# Altium project 24V-70A-Power-Board-v2.0.PrjPcb (part 8 of 8)
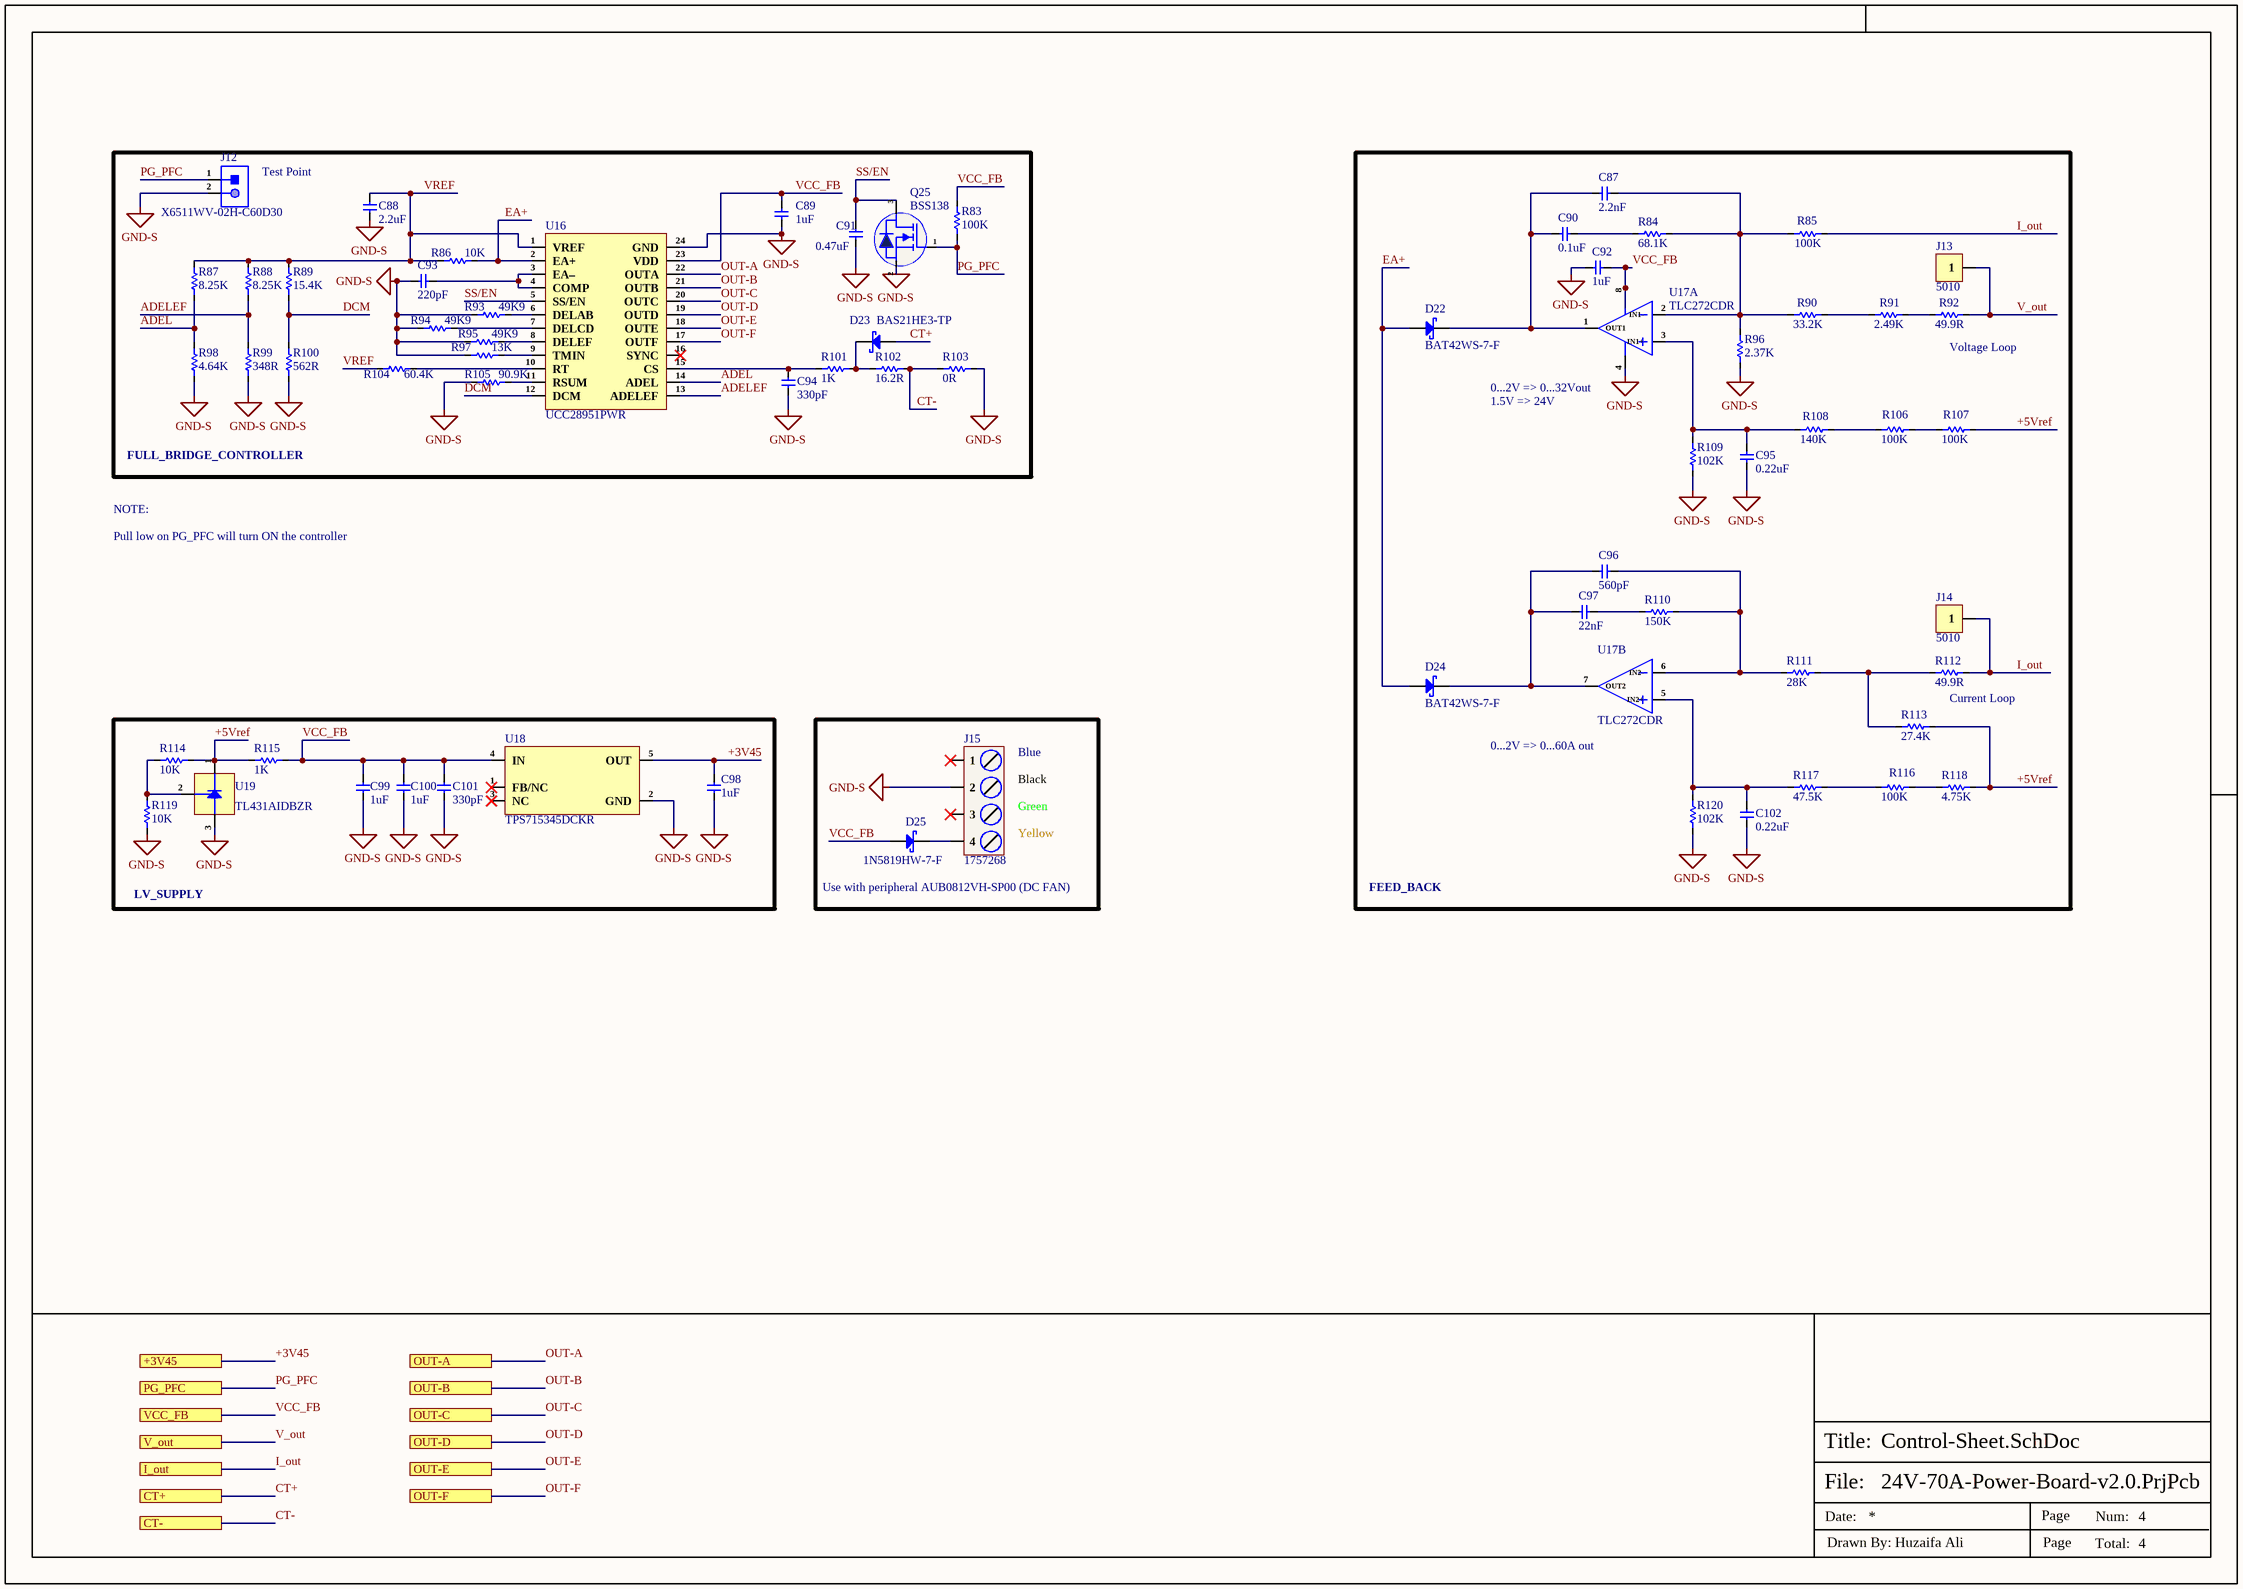
[diagram p10: Control-Sheet.SchDoc]

## Sheet Control-Sheet.SchDoc (continued)

### Library data of the parts (continued)
R101 R115 = CRCW06031K00FKEA: RES SMD 1K OHM 1% 1/10W 0603; Manufacturer: Vishay Dale; Item Type: Resistor; Value: 1kR; Voltage Rating: 75V; Temperature Coefficient: 100ppm/°C; Power Rating: 100mW; LCSC Part Number: C844920; ComponentLink2URL: https://datasheet.ciiva.com/11808/0900766b80d98afc-11808625.pdf?src-supplier=Rs; ComponentLink2Description: https://datasheet.ciiva.com/11808/0900766b80d98afc-11808625.pdf?src-supplier=Rs; ComponentLink3URL: https://datasheet.ciiva.com/46441/1720486-46441623.pdf?src-supplier=Element14; ComponentLink3Description: https://datasheet.ciiva.com/46441/1720486-46441623.pdf?src-supplier=Element14; ComponentLink4URL: https://datasheet.ciiva.com/46441/1720486-46441622.pdf?src-supplier=Element14; ComponentLink4Description: https://datasheet.ciiva.com/46441/1720486-46441622.pdf?src-supplier=Element14; ComponentLink5URL: https://datasheet.ciiva.com/26316/fld-crcw-e3-data-en-26316551.pdf?src-supplier=Distrelec; ComponentLink5Description: https://datasheet.ciiva.com/26316/fld-crcw-e3-data-en-26316551.pdf?src-supplier=Distrelec; ComponentLink6URL: https://datasheet.ciiva.com/2465/dcrcwe3-2465536.pdf?src-supplier=Digi-Key; ComponentLink6Description: https://datasheet.ciiva.com/2465/dcrcwe3-2465536.pdf?src-supplier=Digi-Key; ComponentLink7URL: https://datasheet.ciiva.com/2465/dcrcwe3-2465534.pdf?src-supplier=Digi-Key; ComponentLink7Description: https://datasheet.ciiva.com/2465/dcrcwe3-2465534.pdf?src-supplier=Digi-Key; ComponentLink8URL: https://datasheet.ciiva.com/16199/dcrcwe3-16199053.pdf?src-supplier=Future+Electronics; ComponentLink8Description: https://datasheet.ciiva.com/16199/dcrcwe3-16199053.pdf?src-supplier=Future+Electronics; ComponentLink9URL: https://datasheet.ciiva.com/46385/1697337-46385497.pdf?src-supplier=Element14; ComponentLink9Description: https://datasheet.ciiva.com/46385/1697337-46385497.pdf?src-supplier=Element14; ComponentLink10URL: https://datasheet.ciiva.com/2465/dcrcwe3-2465535.pdf?src-supplier=Digi-Key; ComponentLink10Description: https://datasheet.ciiva.com/2465/dcrcwe3-2465535.pdf?src-supplier=Digi-Key; ComponentLink11URL: https://datasheet.ciiva.com/8336/dcrcwe3-8336822.pdf?src-supplier=Avnet; ComponentLink11Description: https://datasheet.ciiva.com/8336/dcrcwe3-8336822.pdf?src-supplier=Avnet; ComponentLink12URL: https://datasheet.ciiva.com/3257/dcrcwe3-3257132.pdf?src-supplier=Avnet; ComponentLink12Description: https://datasheet.ciiva.com/3257/dcrcwe3-3257132.pdf?src-supplier=Avnet; Supplier: Mouser; Supplier Part Number: 71-CRCW0603-1.0K-E3; Manufacturer Part Number: CRCW06031K00FKEA; RoHS: Yes; Category: Chip SMD Resistors; Stock: 1295653; Pricing: 1=0.1, 10=0.017, 50=0.017, 100=0.01, 1000=0.008, 10000=0.004 (USD); Case/Package: 0603; Pins: 2; Contact Plating: Tin; Weight: 7.1E-05oz; Case Code (Metric): 1608; Case Code (Imperial): 0603; Min Operating Temperature: -55°C; Max Operating Temperature: 155°C; Tolerance: 1%; Resistor Type: Thick Film; Packaging: Tape and Reel; Package Quantity: 5000; Number of Terminations: 2; Termination: SMD/SMT; Max Power Dissipation: 100mW; Features: Automotive AEC-Q200; Series: CRCW; Technology: THICK FILM; Resistance Tolerance: 1%; Voltage Rating (DC): 75V; Construction: Rectangular; Length: 1.55mm; Width: 0.85mm; Height: 0.45mm; Depth: 0.85mm; Ratings: AEC-Q200; Radiation Hardening: No; RoHS Compliant: Yes; Reach SVHC Compliant: Unknown; Lead Free: 5697LeadFree; Military Standard: Not; ComponentLink1URL: https://datasheet.ciiva.com/11808/0900766b80d98afc-11808625.pdf?src-supplier=Rs; ComponentLink1Description: https://datasheet.ciiva.com/11808/0900766b80d98afc-11808625.pdf?src-supplier=Rs; ComponentLink13URL: https://datasheet.ciiva.com/2465/dcrcwe3-2465535.pdf?src-supplier=Digikey; ComponentLink13Description: https://datasheet.ciiva.com/2465/dcrcwe3-2465535.pdf?src-supplier=Digikey; ComponentLink14URL: https://datasheet.ciiva.com/2465/dcrcwe3-2465536.pdf?src-supplier=Digikey; ComponentLink14Description: https://datasheet.ciiva.com/2465/dcrcwe3-2465536.pdf?src-supplier=Digikey; ComponentLink15URL: https://datasheet.ciiva.com/2465/dcrcwe3-2465534.pdf?src-supplier=Digikey; ComponentLink15Description: https://datasheet.ciiva.com/2465/dcrcwe3-2465534.pdf?src-supplier=Digikey
R102 = CRCW251216R2FKEG: RES SMD 16.2 OHM 1% 1W 2512; Manufacturer: Vishay Dale; Item Type: Resistor; Voltage Rating (DC): 500V; Supplier: Mouser; Supplier Part Number: 71-CRCW251216R2FKEG; Manufacturer Part Number: CRCW251216R2FKEG; RoHS: Yes; Stock: 6301; Pricing: 1=0.28, 10=0.122, 50=0.122, 100=0.077, 1000=0.068, 10000=0.044 (USD); Pins: 2NUMBER; Lead Free: 5697LeadFree; ComponentLink1URL: https://datasheet.ciiva.com/16435/dcrcwe3-16435705.pdf?src-supplier=Future+Electronics; ComponentLink1Description: https://datasheet.ciiva.com/16435/dcrcwe3-16435705.pdf?src-supplier=Future+Electronics; ComponentLink2URL: https://datasheet.ciiva.com/5547/dcrcwe3-109170-5547624.pdf?src-supplier=Mouser; ComponentLink2Description: https://datasheet.ciiva.com/5547/dcrcwe3-109170-5547624.pdf?src-supplier=Mouser; ComponentLink3URL: https://datasheet.ciiva.com/9037/dcrcwe3-9037223.pdf?src-supplier=Avnet; ComponentLink3Description: https://datasheet.ciiva.com/9037/dcrcwe3-9037223.pdf?src-supplier=Avnet; ComponentLink4URL: https://datasheet.ciiva.com/7695/dcrcwe3-7695070.pdf?src-supplier=Element14; ComponentLink4Description: https://datasheet.ciiva.com/7695/dcrcwe3-7695070.pdf?src-supplier=Element14
R103 = RC1206JR-070RL: RES 0 OHM JUMPER 1/4W 1206; Manufacturer: Yageo; Item Type: Resistors; Value: 0mR; Tolerance: 5%; Power Rating: 250mW; Voltage Rating: 200V; Temperature Coefficient: 200ppm/°C; Supplier: Future Electronics; Supplier Part Number: 1414689; Manufacturer Part Number: RC1206JR-070RL; RoHS: Yes; Stock: 1115000; Pricing: 5000=0.0025, 15000=0.0039, 25000=0.0023, 50000=0.0037, 100000=0.0022, 200000=0.0035, 250000=0.0021, 625000=0.002 (USD); Case/Package: 1206; Contact Plating: Tin,Matte; Case Code (Metric): 3216; Case Code (Imperial): 1206; Min Operating Temperature: -55°C; Max Operating Temperature: 155°C; Resistor Type: Thick Film,Carbon Film; Packaging: Tape and Reel; Package Quantity: 1; Number of Terminations: 2; Termination: SMD/SMT; Max Power Dissipation: 250mW; Series: RC; Resistance Tolerance: 5%; Technology: THICK FILM; Features: Moisture Resistant; Length: 0.122inch; Width: 0.063inch; Height: 0.026inch; Depth: 1.6mm; RoHS Compliant: Yes; Reach SVHC Compliant: Unknown; Lead Free: 5697LeadFree; ComponentLink1URL: https://datasheet.ciiva.com/11808/0900766b80c6630a-11808156.pdf?src-supplier=Rs; ComponentLink1Description: https://datasheet.ciiva.com/11808/0900766b80c6630a-11808156.pdf?src-supplier=Rs; ComponentLink2URL: https://datasheet.ciiva.com/29181/402222-da-01-en-smd-widerstand-0-ohm-1206-29181568.pdf?src-supplier=Conrad; ComponentLink2Description: https://datasheet.ciiva.com/29181/402222-da-01-en-smd-widerstand-0-ohm-1206-29181568.pdf?src-supplier=Conrad; ComponentLink3URL: https://datasheet.ciiva.com/7983/444357-7983807.pdf?src-supplier=Element14; ComponentLink3Description: https://datasheet.ciiva.com/7983/444357-7983807.pdf?src-supplier=Element14; ComponentLink4URL: https://datasheet.ciiva.com/22747/1692832-22747541.pdf?src-supplier=Element14; ComponentLink4Description: https://datasheet.ciiva.com/22747/1692832-22747541.pdf?src-supplier=Element14; ComponentLink5URL: https://datasheet.ciiva.com/46445/444357-46445719.pdf?src-supplier=Element14; ComponentLink5Description: https://datasheet.ciiva.com/46445/444357-46445719.pdf?src-supplier=Element14; ComponentLink6URL: https://datasheet.ciiva.com/2458/pyu-rc1206-51-rohs-l-4-2458669.pdf?src-supplier=Digikey; ComponentLink6Description: https://datasheet.ciiva.com/2458/pyu-rc1206-51-rohs-l-4-2458669.pdf?src-supplier=Digikey; ComponentLink7URL: https://datasheet.ciiva.com/2458/pyu-rc1206-51-rohs-l-4-2458670.pdf?src-supplier=Digikey; ComponentLink7Description: https://datasheet.ciiva.com/2458/pyu-rc1206-51-rohs-l-4-2458670.pdf?src-supplier=Digikey; ComponentLink8URL: https://datasheet.ciiva.com/2458/pyu-rc1206-51-rohs-l-4-2458668.pdf?src-supplier=Digikey; ComponentLink8Description: https://datasheet.ciiva.com/2458/pyu-rc1206-51-rohs-l-4-2458668.pdf?src-supplier=Digikey; ComponentLink9URL: https://datasheet.ciiva.com/7857/1692832-7857422.pdf?src-supplier=Element14; ComponentLink9Description: https://datasheet.ciiva.com/7857/1692832-7857422.pdf?src-supplier=Element14; ComponentLink10URL: https://datasheet.ciiva.com/7857/1692832-7857421.pdf?src-supplier=Element14; ComponentLink10Description: https://datasheet.ciiva.com/7857/1692832-7857421.pdf?src-supplier=Element14; ComponentLink11URL: https://datasheet.ciiva.com/17035/pyu-rc1206-51-rohs-l-4-17035512.pdf?src-supplier=Future+Electronics; ComponentLink11Description: https://datasheet.ciiva.com/17035/pyu-rc1206-51-rohs-l-4-17035512.pdf?src-supplier=Future+Electronics
R104 = CRCW060360K4FKEA: RES SMD 60.4K OHM 1% 1/10W 0603; Manufacturer: Vishay; Item Type: Resistors; Voltage Rating (DC): 75V; Supplier: Digikey; LCSC Part Number: C844800; Manufacturer Part Number: CRCW060360K4FKEA; RoHS: Yes; Stock: 57146; Pricing: 1=0.1, 10=0.026, 50=0.0166, 100=0.014, 500=0.00954, 1000=0.00824 (USD); Lead Free: 5697LeadFree; ComponentLink1URL: https://datasheet.ciiva.com/11809/0900766b80d98afc-11809685.pdf?src-supplier=Rs; ComponentLink1Description: https://datasheet.ciiva.com/11809/0900766b80d98afc-11809685.pdf?src-supplier=Rs; ComponentLink2URL: https://datasheet.ciiva.com/2494/dcrcwe3-2494471.pdf?src-supplier=Digikey; ComponentLink2Description: https://datasheet.ciiva.com/2494/dcrcwe3-2494471.pdf?src-supplier=Digikey; ComponentLink3URL: https://datasheet.ciiva.com/2494/dcrcwe3-2494472.pdf?src-supplier=Digikey; ComponentLink3Description: https://datasheet.ciiva.com/2494/dcrcwe3-2494472.pdf?src-supplier=Digikey; ComponentLink4URL: https://datasheet.ciiva.com/2494/dcrcwe3-2494473.pdf?src-supplier=Digikey; ComponentLink4Description: https://datasheet.ciiva.com/2494/dcrcwe3-2494473.pdf?src-supplier=Digikey; ComponentLink5URL: https://datasheet.ciiva.com/3257/dcrcwe3-3257786.pdf?src-supplier=Avnet; ComponentLink5Description: https://datasheet.ciiva.com/3257/dcrcwe3-3257786.pdf?src-supplier=Avnet; ComponentLink6URL: https://datasheet.ciiva.com/3257/dcrcwe3-3257787.pdf?src-supplier=Avnet; ComponentLink6Description: https://datasheet.ciiva.com/3257/dcrcwe3-3257787.pdf?src-supplier=Avnet; ComponentLink7URL: https://datasheet.ciiva.com/16391/dcrcwe3-16391304.pdf?src-supplier=Future+Electronics; ComponentLink7Description: https://datasheet.ciiva.com/16391/dcrcwe3-16391304.pdf?src-supplier=Future+Electronics; ComponentLink8URL: https://datasheet.ciiva.com/22676/1847332-22676330.pdf?src-supplier=Element14; ComponentLink8Description: https://datasheet.ciiva.com/22676/1847332-22676330.pdf?src-supplier=Element14; ComponentLink9URL: https://datasheet.ciiva.com/16760/70201119-16760503.pdf?src-supplier=Allied+Electronics; ComponentLink9Description: https://datasheet.ciiva.com/16760/70201119-16760503.pdf?src-supplier=Allied+Electronics; ComponentLink10URL: https://datasheet.ciiva.com/5545/dcrcwe3-109170-5545721.pdf?src-supplier=Mouser; ComponentLink10Description: https://datasheet.ciiva.com/5545/dcrcwe3-109170-5545721.pdf?src-supplier=Mouser; ComponentLink11URL: https://datasheet.ciiva.com/7816/1697337-7816053.pdf?src-supplier=Element14; ComponentLink11Description: https://datasheet.ciiva.com/7816/1697337-7816053.pdf?src-supplier=Element14
R105 = RC0603FR-0790K9L: RES 90.9K OHM 1% 1/10W 0603; Manufacturer: Yageo; Item Type: Resistors; Voltage Rating (DC): 50V; Supplier: Future Electronics; LCSC Part Number: C185305; Manufacturer Part Number: RC0603FR-0790K9L; RoHS: Yes; Stock: 100000; Pricing: 5000=0.0022, 50000=0.0021, 150000=0.0021, 375000=0.002, 1000000=0.0019 (USD); Lead Free: 5697LeadFree; RoHS Compliant: 5897YesNo; ComponentLink1URL: https://datasheet.ciiva.com/15189/getdatasheetpartid-325203-15189835.pdf?src-supplier=Verical; ComponentLink1Description: https://datasheet.ciiva.com/15189/getdatasheetpartid-325203-15189835.pdf?src-supplier=Verical
R108 = RC0603FR-07140KL: RES 140K OHM 1% 1/10W 0603; Manufacturer: Yageo; Item Type: Resistor; Voltage Rating (DC): 50V; Supplier: Future Electronics; LCSC Part Number: C185372; Manufacturer Part Number: RC0603FR-07140KL; RoHS: Yes; Stock: 215000; Pricing: 5000=0.0015, 50000=0.0014, 150000=0.0014, 375000=0.0013, 1000000=0.0012 (USD); Lead Free: 5697LeadFree; ComponentLink1URL: https://datasheet.ciiva.com/2453/pyu-r-int-thick-7-2453916.pdf?src-supplier=Digikey; ComponentLink1Description: https://datasheet.ciiva.com/2453/pyu-r-int-thick-7-2453916.pdf?src-supplier=Digikey; ComponentLink2URL: https://datasheet.ciiva.com/2453/pyu-r-int-thick-7-2453917.pdf?src-supplier=Digikey; ComponentLink2Description: https://datasheet.ciiva.com/2453/pyu-r-int-thick-7-2453917.pdf?src-supplier=Digikey; ComponentLink3URL: https://datasheet.ciiva.com/2453/pyu-r-int-thick-7-2453918.pdf?src-supplier=Digikey; ComponentLink3Description: https://datasheet.ciiva.com/2453/pyu-r-int-thick-7-2453918.pdf?src-supplier=Digikey
R109 R120 = RT0603BRE07102KL: RES SMD 102K OHM 0.1% 1/10W 0603; Manufacturer: Yageo; Item Type: Resistor; Value: 102kR; Max Power Dissipation: 100mW; Temperature Coefficient: 50ppm/°C; Voltage Rating (DC): 50V; Supplier: Digikey; LCSC Part Number: C861617; Manufacturer Part Number: RT0603BRE07102KL; RoHS: Yes; Pricing: 5000=0.04446 (USD); Case/Package: 0603; Contact Plating: Tin,Matte; Min Operating Temperature: -55°C; Max Operating Temperature: 155°C; Packaging: Tape and Reel; Tolerance: 0.1%; Number of Terminations: 2; Series: RT; Lead Free: Lead Free; RoHS Compliant: Yes; ComponentLink1URL: https://datasheet.ciiva.com/2584/pyu-rt-1-to-0-05-rohs-l-5-2584160.pdf?src-supplier=Digikey; ComponentLink1Description: https://datasheet.ciiva.com/2584/pyu-rt-1-to-0-05-rohs-l-5-2584160.pdf?src-supplier=Digikey; ComponentLink2URL: https://datasheet.ciiva.com/8887/pyu-rt-1-to-0-05-rohs-l-4-8887854.pdf?src-supplier=Avnet; ComponentLink2Description: https://datasheet.ciiva.com/8887/pyu-rt-1-to-0-05-rohs-l-4-8887854.pdf?src-supplier=Avnet
R110 = CRCW0603150KFKEA: RES 150K OHM 1% 1/10W 0603; Manufacturer: Vishay; Item Type: Resistor; Value: 150kR; Power Rating: 100mW; Voltage Rating: 75V; Temperature Coefficient: 100ppm/°C; Supplier: Mouser; Supplier Part Number: 71-CRCW0603-150K-E3; Manufacturer Part Number: CRCW0603150KFKEA; RoHS: Yes; Stock: 73041; Pricing: 1=0.1, 10=0.017, 50=0.017, 100=0.01, 1000=0.008, 10000=0.004 (USD); Case/Package: 0603; Weight: 7.1E-05oz; Case Code (Imperial): 0603; Case Code (Metric): 1608; Contact Plating: Tin; Min Operating Temperature: -55°C; Max Operating Temperature: 155°C; Tolerance: 1%; Resistor Type: Thick Film; Packaging: Tape and Reel; Package Quantity: 5000; Termination: SMD/SMT; Features: Automotive AEC-Q200; Series: CRCW; Max Power Dissipation: 100mW; Number of Terminations: 2; Construction: Rectangular; Technology: THICK FILM; Resistance Tolerance: 1%; Voltage Rating (DC): 75V; Length: 1.55mm; Width: 0.85mm; Height: 0.45mm; Depth: 0.85mm; Lead Free: 5697LeadFree; Military Standard: Not; RoHS Compliant: Yes; Reach SVHC Compliant: Unknown; ComponentLink1URL: https://datasheet.ciiva.com/11809/0900766b80d98afc-11809072.pdf?src-supplier=Rs; ComponentLink1Description: https://datasheet.ciiva.com/11809/0900766b80d98afc-11809072.pdf?src-supplier=Rs; ComponentLink2URL: https://datasheet.ciiva.com/7673/1697337-7673288.pdf?src-supplier=Element14; ComponentLink2Description: https://datasheet.ciiva.com/7673/1697337-7673288.pdf?src-supplier=Element14; ComponentLink3URL: https://datasheet.ciiva.com/16761/70201119-16761887.pdf?src-supplier=Allied+Electronics; ComponentLink3Description: https://datasheet.ciiva.com/16761/70201119-16761887.pdf?src-supplier=Allied+Electronics; ComponentLink4URL: https://datasheet.ciiva.com/5551/dcrcwe3-109170-5551862.pdf?src-supplier=Mouser; ComponentLink4Description: https://datasheet.ciiva.com/5551/dcrcwe3-109170-5551862.pdf?src-supplier=Mouser; ComponentLink5URL: https://datasheet.ciiva.com/3257/dcrcwe3-3257049.pdf?src-supplier=Avnet; ComponentLink5Description: https://datasheet.ciiva.com/3257/dcrcwe3-3257049.pdf?src-supplier=Avnet; ComponentLink6URL: https://datasheet.ciiva.com/16391/dcrcwe3-16391407.pdf?src-supplier=Future+Electronics; ComponentLink6Description: https://datasheet.ciiva.com/16391/dcrcwe3-16391407.pdf?src-supplier=Future+Electronics; ComponentLink7URL: https://datasheet.ciiva.com/15159/getdatasheetpartid-37540-15159436.pdf?src-supplier=Verical; ComponentLink7Description: https://datasheet.ciiva.com/15159/getdatasheetpartid-37540-15159436.pdf?src-supplier=Verical
R111 = RT0603BRD0728KL: RES SMD 28K OHM 0.1% 1/10W 0603; Manufacturer: Yageo; Item Type: Resistors; Supplier: Digikey; LCSC Part Number: C705756; Manufacturer Part Number: RT0603BRD0728KL; RoHS: Yes; Stock: 2021; Pricing: 1=0.14, 10=0.106, 50=0.0846, 100=0.0755, 500=0.05814, 1000=0.051 (USD); ComponentLink1URL: http://www.mouser.com/ds/2/447/yageodocoutput-1125656.pdf?src-supplier=Mouser; ComponentLink1Description: http://www.mouser.com/ds/2/447/yageodocoutput-1125656.pdf?src-supplier=Mouser; ComponentLink2URL: https://datasheet.octopart.com/RT0603BRD0728KL-Yageo-datasheet-166250672.pdf?src-supplier=Future+Electronics; ComponentLink2Description: https://datasheet.octopart.com/RT0603BRD0728KL-Yageo-datasheet-166250672.pdf?src-supplier=Future+Electronics; ComponentLink3URL: https://www.yageo.com/upload/media/product/productsearch/datasheet/rchip/PYu-RT_1-to-0.01_RoHS_L_12.pdf?src-supplier=Digikey; ComponentLink3Description: https://www.yageo.com/upload/media/product/productsearch/datasheet/rchip/PYu-RT_1-to-0.01_RoHS_L_12.pdf?src-supplier=Digikey; ComponentLink4URL: http://www.yageo.com/documents/recent/PYu-RT_1-to-0.01_RoHS_L_9.pdf?src-supplier=Digikey; ComponentLink4Description: http://www.yageo.com/documents/recent/PYu-RT_1-to-0.01_RoHS_L_9.pdf?src-supplier=Digikey; ComponentLink5URL: http://www.yageo.com/documents/recent/PYu-RT_1-to-0.05_RoHS_L_6.pdf?src-supplier=Avnet; ComponentLink5Description: http://www.yageo.com/documents/recent/PYu-RT_1-to-0.05_RoHS_L_6.pdf?src-supplier=Avnet
R113 = RT0603BRD0727K4L: RES SMD 27.4KOHM 0.1% 1/10W 0603; Manufacturer: Yageo; Item Type: Resistors; Supplier: Future Electronics; LCSC Part Number: C861274; Manufacturer Part Number: RT0603BRD0727K4L; RoHS: Yes; Stock: 5000; Pricing: 5000=0.0277, 15000=0.0267, 25000=0.0262, 50000=0.0256, 100000=0.0247 (USD); ComponentLink1URL: https://datasheet.ciiva.com/8889/pyu-rt-1-to-0-05-rohs-l-4-8889871.pdf?src-supplier=Avnet; ComponentLink1Description: https://datasheet.ciiva.com/8889/pyu-rt-1-to-0-05-rohs-l-4-8889871.pdf?src-supplier=Avnet; ComponentLink2URL: https://datasheet.ciiva.com/12724/pyu-rt-1-to-0-05-rohs-l-4-12724007.pdf?src-supplier=Mouser; ComponentLink2Description: https://datasheet.ciiva.com/12724/pyu-rt-1-to-0-05-rohs-l-4-12724007.pdf?src-supplier=Mouser
R117 = CRCW060347K5FKEA: RES SMD 47.5K OHM 1% 1/10W 0603; Manufacturer: Vishay; Item Type: Resistors; Value: 47.5kR; Temperature Coefficient: 100ppm/°C; Max Power Dissipation: 100mW; Voltage Rating: 75V; Supplier: Mouser; LCSC Part Number: C844568; Manufacturer Part Number: CRCW060347K5FKEA; RoHS: Yes; Stock: 130545; Pricing: 1=0.1, 10=0.016, 50=0.016, 100=0.01, 1000=0.009, 10000=0.004 (USD); Case/Package: 0603; Weight: 7.1E-05oz; Case Code (Imperial): 0603; Case Code (Metric): 1608; Contact Plating: Tin; Min Operating Temperature: -55°C; Max Operating Temperature: 155°C; Tolerance: 1%; Packaging: Tape and Reel; Package Quantity: 10; Number of Terminations: 2; Features: Automotive AEC-Q200; Series: CRCW; Power Rating: 100mW; Resistor Type: Thick Film; Termination: SMD/SMT; Resistance Tolerance: 1%; Construction: Rectangular; Technology: THICK FILM; Voltage Rating (DC): 75V; Length: 1.55mm; Width: 0.033inch; Height: 0.45mm; Depth: 0.85mm; Radiation Hardening: No; RoHS Compliant: Yes; Military Standard: Not; Reach SVHC Compliant: Unknown; ComponentLink1URL: https://datasheet.ciiva.com/11810/0900766b80d98afc-11810543.pdf?src-supplier=Rs; ComponentLink1Description: https://datasheet.ciiva.com/11810/0900766b80d98afc-11810543.pdf?src-supplier=Rs; ComponentLink2URL: https://datasheet.ciiva.com/7841/1697337-7841832.pdf?src-supplier=Element14; ComponentLink2Description: https://datasheet.ciiva.com/7841/1697337-7841832.pdf?src-supplier=Element14; ComponentLink3URL: https://datasheet.ciiva.com/7841/125364-7841833.pdf?src-supplier=Element14; ComponentLink3Description: https://datasheet.ciiva.com/7841/125364-7841833.pdf?src-supplier=Element14; ComponentLink4URL: https://datasheet.ciiva.com/2465/dcrcwe3-2465817.pdf?src-supplier=Digikey; ComponentLink4Description: https://datasheet.ciiva.com/2465/dcrcwe3-2465817.pdf?src-supplier=Digikey; ComponentLink5URL: https://datasheet.ciiva.com/2465/dcrcwe3-2465818.pdf?src-supplier=Digikey; ComponentLink5Description: https://datasheet.ciiva.com/2465/dcrcwe3-2465818.pdf?src-supplier=Digikey; ComponentLink6URL: https://datasheet.ciiva.com/2465/dcrcwe3-2465816.pdf?src-supplier=Digikey; ComponentLink6Description: https://datasheet.ciiva.com/2465/dcrcwe3-2465816.pdf?src-supplier=Digikey; ComponentLink7URL: https://datasheet.ciiva.com/16769/70201119-16769373.pdf?src-supplier=Allied+Electronics; ComponentLink7Description: https://datasheet.ciiva.com/16769/70201119-16769373.pdf?src-supplier=Allied+Electronics
R118 = CRCW06034K75FKEA: RES SMD 4.75K OHM 1% 1/10W 0603; Manufacturer: Vishay; Item Type: Resistors; Voltage Rating (DC): 75V; Supplier: Mouser; LCSC Part Number: C844570; Manufacturer Part Number: CRCW06034K75FKEA; RoHS: Yes; Stock: 103605; Pricing: 1=0.1, 10=0.017, 50=0.017, 100=0.01, 1000=0.008, 10000=0.004 (USD); Lead Free: 5697LeadFree; ComponentLink1URL: https://datasheet.ciiva.com/11810/0900766b80d98afc-11810668.pdf?src-supplier=Rs; ComponentLink1Description: https://datasheet.ciiva.com/11810/0900766b80d98afc-11810668.pdf?src-supplier=Rs; ComponentLink2URL: https://datasheet.ciiva.com/16754/70201119-16754725.pdf?src-supplier=Allied+Electronics; ComponentLink2Description: https://datasheet.ciiva.com/16754/70201119-16754725.pdf?src-supplier=Allied+Electronics; ComponentLink3URL: https://datasheet.ciiva.com/16199/dcrcwe3-16199173.pdf?src-supplier=Future+Electronics; ComponentLink3Description: https://datasheet.ciiva.com/16199/dcrcwe3-16199173.pdf?src-supplier=Future+Electronics; ComponentLink4URL: https://datasheet.ciiva.com/22707/1697337-22707751.pdf?src-supplier=Element14; ComponentLink4Description: https://datasheet.ciiva.com/22707/1697337-22707751.pdf?src-supplier=Element14; ComponentLink5URL: https://datasheet.ciiva.com/7690/1697337-7690725.pdf?src-supplier=Element14; ComponentLink5Description: https://datasheet.ciiva.com/7690/1697337-7690725.pdf?src-supplier=Element14; ComponentLink6URL: https://datasheet.ciiva.com/7690/1697337-7690726.pdf?src-supplier=Element14; ComponentLink6Description: https://datasheet.ciiva.com/7690/1697337-7690726.pdf?src-supplier=Element14; ComponentLink7URL: https://datasheet.ciiva.com/16788/70201119-16788508.pdf?src-supplier=Allied+Electronics; ComponentLink7Description: https://datasheet.ciiva.com/16788/70201119-16788508.pdf?src-supplier=Allied+Electronics; ComponentLink8URL: https://datasheet.ciiva.com/3257/dcrcwe3-3257669.pdf?src-supplier=Avnet; ComponentLink8Description: https://datasheet.ciiva.com/3257/dcrcwe3-3257669.pdf?src-supplier=Avnet; ComponentLink9URL: https://datasheet.ciiva.com/5541/dcrcwe3-109170-5541322.pdf?src-supplier=Mouser; ComponentLink9Description: https://datasheet.ciiva.com/5541/dcrcwe3-109170-5541322.pdf?src-supplier=Mouser
U16 = UCC28951PWR: PWR MGMT MOSFET/PWR DRIVER; Manufacturer: Texas Instruments; Item Type: IC; Output Configuration: Positive; Number of Outputs: 6; Number of Output Phases: 1; Switching Frequency: 1MHz; Max Duty Cycle: 95%; Synchronous Rectifier: Yes; Supplier: Mouser; LCSC Part Number: C1849524; Manufacturer Part Number: UCC28951PWR; RoHS: Yes; Stock: 2468; Pricing: 1=6.18, 10=4.19, 50=4.19, 100=3.75, 1000=3.27, 10000=2.88 (USD); Case/Package: TSSOP; Min Operating Temperature: -40°C; Max Operating Temperature: 125°C; Packaging: Tape and Reel; Clock Sync: Yes; Series: -; RoHS Compliant: Yes; ComponentLink1URL: http://www.ti.com/general/docs/suppproductinfo.tsp?distId=10&amp;gotoUrl=http%3A%2F%2Fwww.ti.com%2Flit%2Fgpn%2Fucc28951&src-supplier=Digikey; ComponentLink1Description: http://www.ti.com/general/docs/suppproductinfo.tsp?distId=10&amp;gotoUrl=http%3A%2F%2Fwww.ti.com%2Flit%2Fgpn%2Fucc28951&src-supplier=Digikey
U17 = TLC272CDR: IC CMOS 2 CIRCUIT 8SOIC; Manufacturer: Texas Instruments; Max Supply Voltage: 16V; Min Supply Voltage: 3V; Voltage Gain: 87.23dB; Common Mode Rejection Ratio: 65dB; Gain Bandwidth Product: 1.7MHz; Number of Channels: 2; Slew Rate: 3.6V/µs; Max I/O Voltage: 10mV; Input Bias Current: 60pA; Operating Supply Current: 1.9mA; Output Current per Channel: 30mA; Amplifier Type: GENERAL PURPOSE; Supply Current: 4mA; Power Dissipation: 725mW; Supplier: Mouser; LCSC Part Number: C9374; Manufacturer Part Number: TLC272CDR; RoHS: Yes; Item Type: IC; Stock: 26547; Pricing: 1=1.37, 10=0.858, 50=0.858, 100=0.691, 1000=0.631, 10000=0.519 (USD); Case/Package: D; Pins: 8; Min Operating Temperature: -40°C; Max Operating Temperature: 85°C; Packaging: Tape and Reel; Bandwidth: 1.7MHz; Package Quantity: 1; Nominal Gain Bandwidth Product: 1.7MHz; Number of Circuits: 2; Input Offset Voltage (Vos): 10mV; Series: LinCMOS™; Unity Gain Bandwidth Product: 1.7MHz; Number of Elements: 2; Number of Amplifiers: 2; Length: 4.9mm; Width: 3.91mm; Height: 1.58mm; Thickness: 1.58mm; Radiation Hardening: No; Lead Free: Lead Free; RoHS Compliant: Yes; Reach SVHC Compliant: No; ComponentLink1URL: https://datasheet.ciiva.com/46392/1831142-46392281.pdf?src-supplier=Element14; ComponentLink1Description: https://datasheet.ciiva.com/46392/1831142-46392281.pdf?src-supplier=Element14; ComponentLink2URL: https://datasheet.ciiva.com/1797/tlc272a-1797237.pdf?src-supplier=Digikey; ComponentLink2Description: https://datasheet.ciiva.com/1797/tlc272a-1797237.pdf?src-supplier=Digikey; ComponentLink3URL: https://datasheet.ciiva.com/1797/tlc272a-1797236.pdf?src-supplier=Digikey; ComponentLink3Description: https://datasheet.ciiva.com/1797/tlc272a-1797236.pdf?src-supplier=Digikey; ComponentLink4URL: https://datasheet.ciiva.com/1797/tlc272a-1797238.pdf?src-supplier=Digikey; ComponentLink4Description: https://datasheet.ciiva.com/1797/tlc272a-1797238.pdf?src-supplier=Digikey; ComponentLink5URL: https://datasheet.ciiva.com/14456/tlc277-14456667.pdf?src-supplier=Avnet; ComponentLink5Description: https://datasheet.ciiva.com/14456/tlc277-14456667.pdf?src-supplier=Avnet
U18 = TPS715345DCKR: IC REG LINEAR 3.45V 50MA SC70-5; Manufacturer: Texas Instruments; Number of Channels: 1NUMBER; Supplier: Mouser; LCSC Part Number: C473350; Manufacturer Part Number: TPS715345DCKR; RoHS: Yes; Item Type: IC; Stock: 16749; Pricing: 1=0.53, 10=0.394, 50=0.394, 100=0.335, 1000=0.302, 10000=0.277 (USD); Thickness: 900um; ComponentLink1URL: https://datasheet.ciiva.com/7992/1854688-7992974.pdf?src-supplier=Element14; ComponentLink1Description: https://datasheet.ciiva.com/7992/1854688-7992974.pdf?src-supplier=Element14
U19 = TL431AIDBZR: IC VREF SHUNT ADJ 1% SOT23-3; Manufacturer: Texas Instruments; Output Voltage: 36V; Number of Channels: 1; Cathode Current: 700uA; Output Current: 100mA; Reference Type: Shunt,Adjustable; Min Input Voltage: 2.495V; Max Supply Voltage: 37V; Temperature Coefficient: 92ppm/°C; Output Type: Adjustable; Supplier: Mouser; LCSC Part Number: C23892; Manufacturer Part Number: TL431AIDBZR; RoHS: Yes; Item Type: IC; Stock: 732677; Pricing: 1=0.25, 10=0.142, 50=0.142, 100=0.099, 1000=0.095, 10000=0.08 (USD); Case/Package: SOT-23; Pins: 3; Min Operating Temperature: -40°C; Max Operating Temperature: 125°C; Packaging: Tape and Reel; Package Quantity: 1; Tolerance: 1%; Reference Voltage: 36V; Series: -; Max Output current: 100mA; Min Output Voltage: 2.495V; Max Output Voltage: 36V; Radiation Hardening: No; Lead Free: Lead Free; RoHS Compliant: Yes; Reach SVHC Compliant: No; ComponentLink1URL: https://datasheet.ciiva.com/3235/tl432b-3235600.pdf?src-supplier=Avnet; ComponentLink1Description: https://datasheet.ciiva.com/3235/tl432b-3235600.pdf?src-supplier=Avnet; ComponentLink2URL: https://datasheet.ciiva.com/15148/getdatasheetpartid-171576-15148968.pdf?src-supplier=Verical; ComponentLink2Description: https://datasheet.ciiva.com/15148/getdatasheetpartid-171576-15148968.pdf?src-supplier=Verical; ComponentLink3URL: https://datasheet.ciiva.com/41462/001014548-da-01-en-ic-vref-shunt-prec-tl431aidbzr-sot-3-tid-41462400.pdf?src-supplier=Conrad; ComponentLink3Description: https://datasheet.ciiva.com/41462/001014548-da-01-en-ic-vref-shunt-prec-tl431aidbzr-sot-3-tid-41462400.pdf?src-supplier=Conrad; ComponentLink4URL: https://datasheet.ciiva.com/46397/1887475-46397705.pdf?src-supplier=Element14; ComponentLink4Description: https://datasheet.ciiva.com/46397/1887475-46397705.pdf?src-supplier=Element14; ComponentLink5URL: https://datasheet.ciiva.com/2006/tl431a-2006188.pdf?src-supplier=Digikey; ComponentLink5Description: https://datasheet.ciiva.com/2006/tl431a-2006188.pdf?src-supplier=Digikey; ComponentLink6URL: https://datasheet.ciiva.com/2006/tl431a-2006187.pdf?src-supplier=Digikey; ComponentLink6Description: https://datasheet.ciiva.com/2006/tl431a-2006187.pdf?src-supplier=Digikey; ComponentLink7URL: https://datasheet.ciiva.com/2006/tl431a-2006189.pdf?src-supplier=Digikey; ComponentLink7Description: https://datasheet.ciiva.com/2006/tl431a-2006189.pdf?src-supplier=Digikey

## Nets that join several sheets
EARTH: Power-Sheet (J11.1), PFC-Sheet (5 pins)
GND: Power-Sheet (15 pins), PFC-Sheet (51 pins)
GND-S: Power-Sheet (47 pins), PFC-Sheet (15 pins), Control-Sheet (32 pins)
+3V45: Power-Sheet (R81.1), Control-Sheet (C98.2 U18.5)
+390V: Power-Sheet (L6.1 R49.1), PFC-Sheet (10 pins)
CT+: Power-Sheet (L7.1 R48.2), Control-Sheet (D23.1)
CT-: Power-Sheet (L7.4 R48.1), Control-Sheet (R102.2 R103.1)
I_out: Power-Sheet (C86.1 R82.2 U13.1), Control-Sheet (J14.1 R85.2 R112.2)
OUT-A: Power-Sheet (U15.4), Control-Sheet (U16.22)
OUT-B: Power-Sheet (U15.2), Control-Sheet (U16.21)
OUT-C: Power-Sheet (U14.4), Control-Sheet (U16.20)
OUT-D: Power-Sheet (U14.2), Control-Sheet (U16.19)
OUT-E: Power-Sheet (U11.2 U11.4), Control-Sheet (U16.18)
OUT-F: Power-Sheet (U12.2 U12.4), Control-Sheet (U16.17)
PG_PFC: PFC-Sheet (U4.4), Control-Sheet (J12.1 Q25.1 R83.1)
V_out: Power-Sheet (12 pins), Control-Sheet (J13.1 R92.2)
VCC_FB: Power-Sheet (16 pins), PFC-Sheet (11 pins), Control-Sheet (11 pins)